# Altium project GTV3.4_Board.PrjPcb (part 11 of 11)
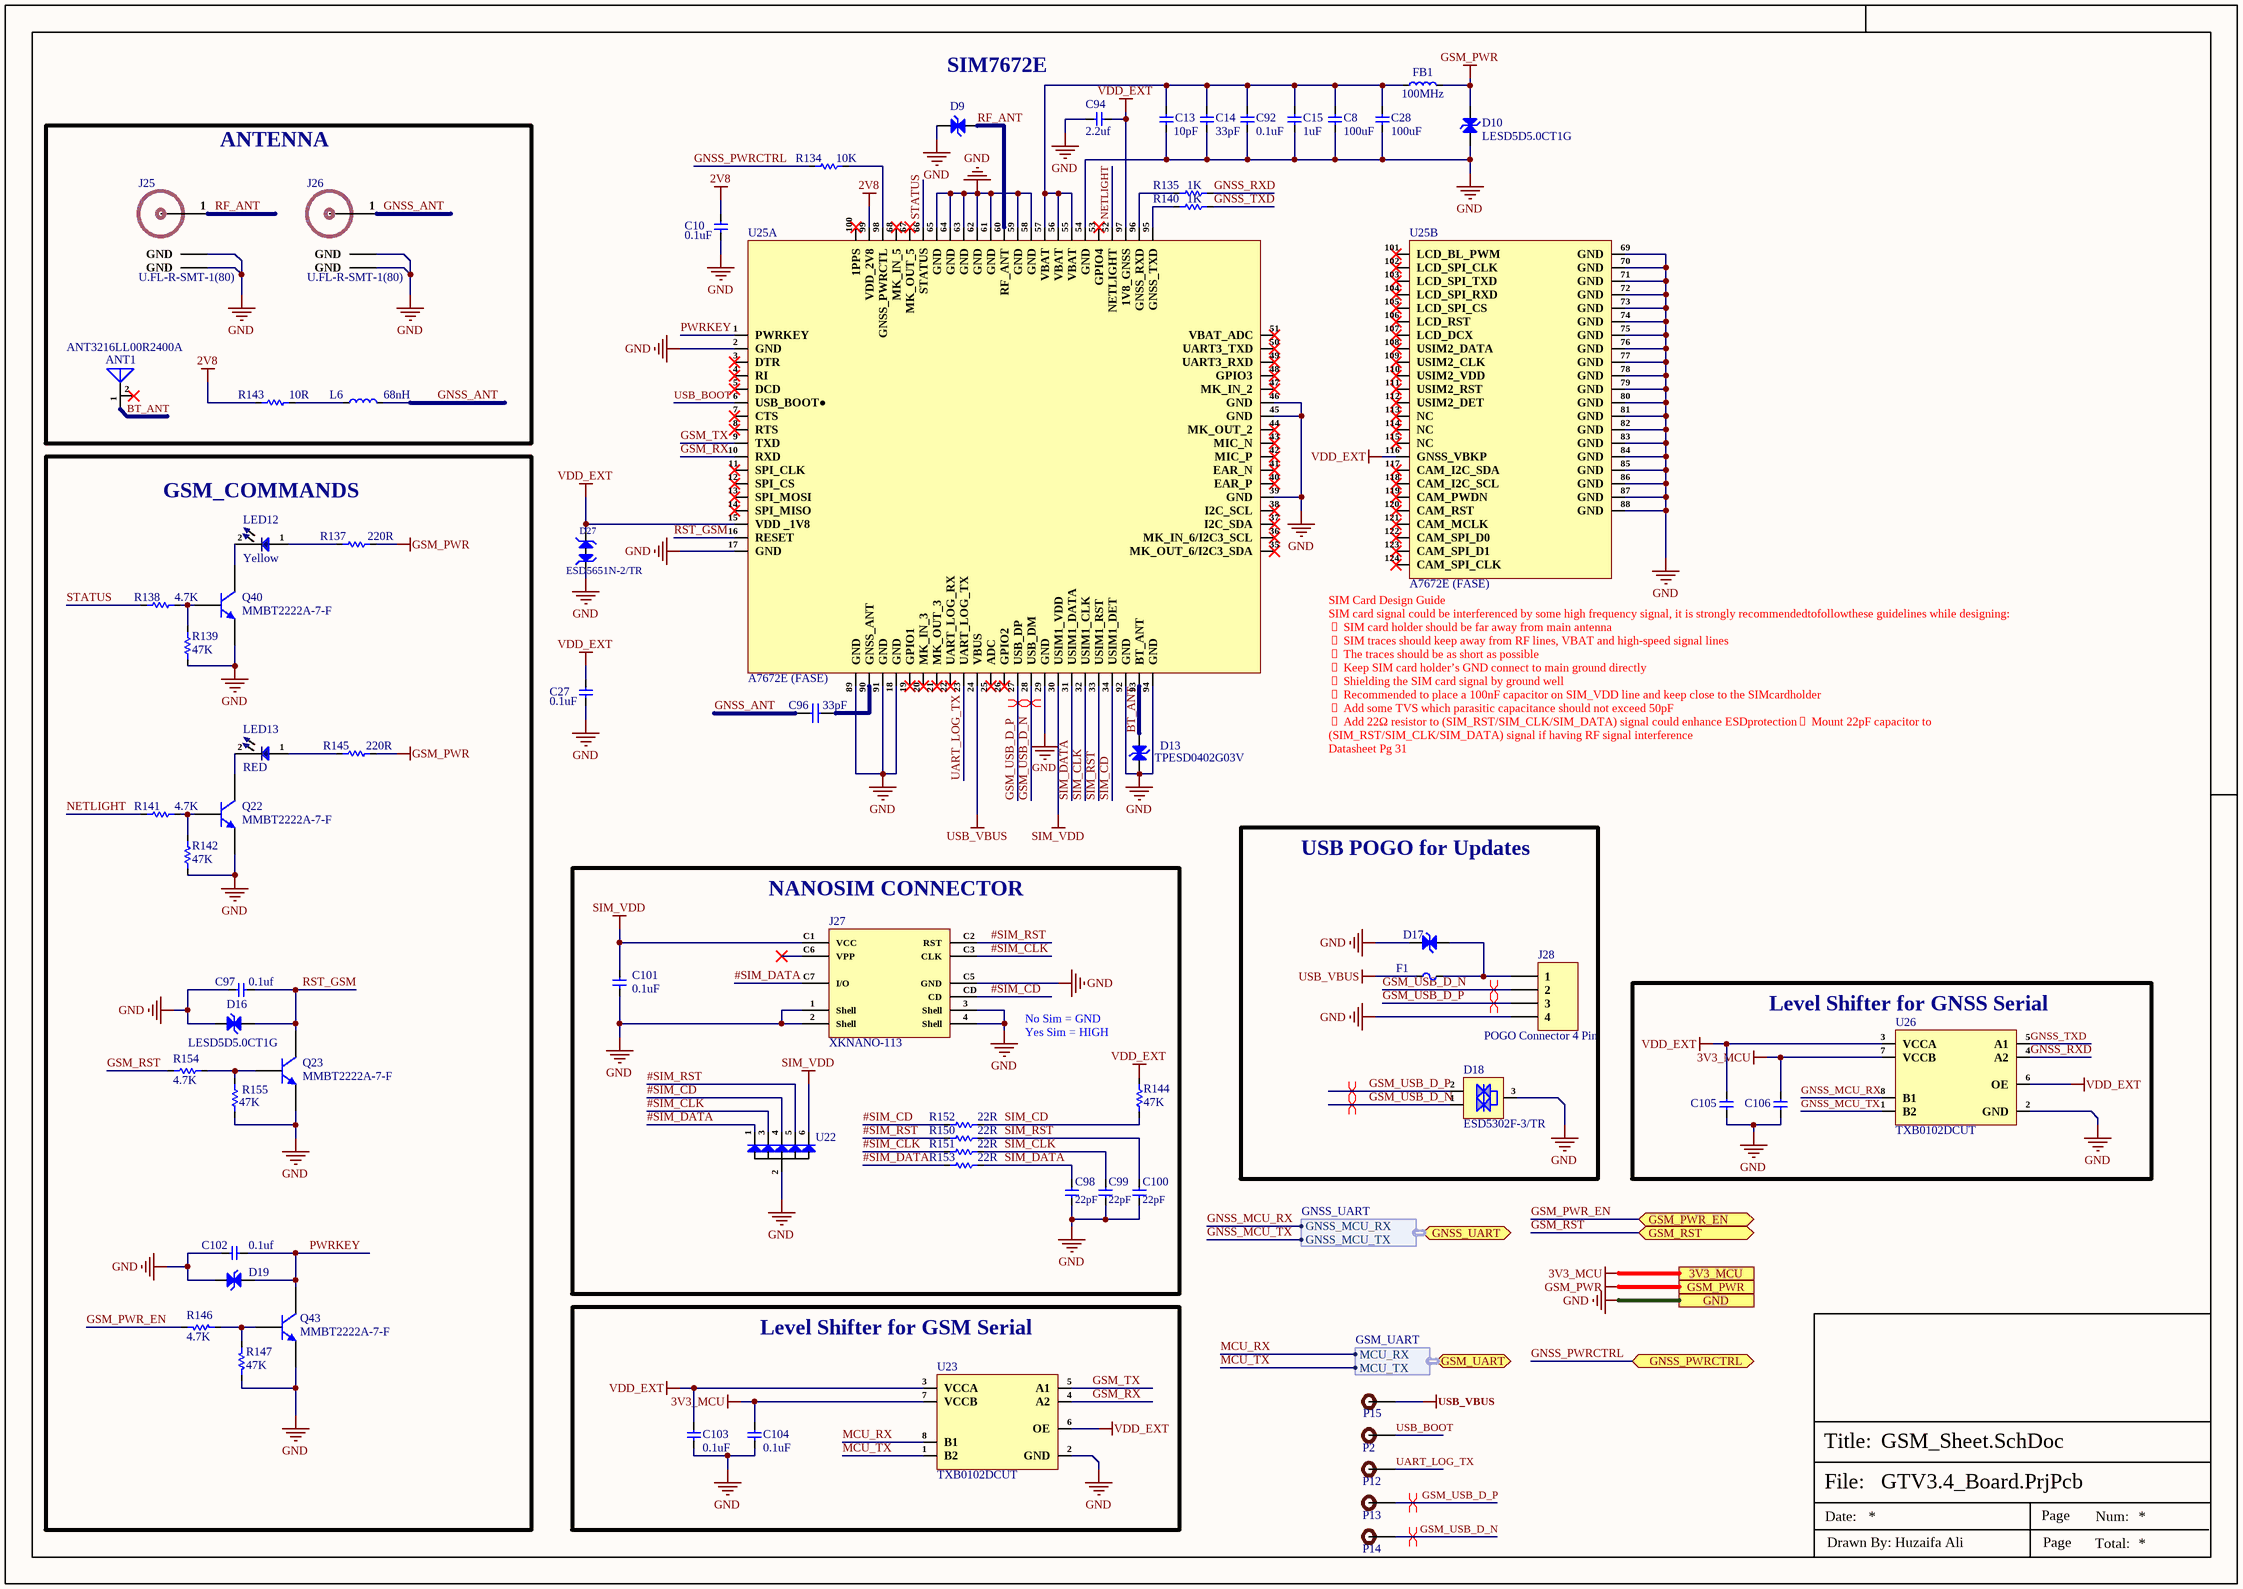
[diagram p25: GSM_Sheet.SchDoc]

## Sheet GSM_Sheet.SchDoc (continued)

### Library data of the parts (continued)
R154 = RC0402FR-074K7L: RES 4.7K OHM 1% 1/16W 0402; Manufacturer: Yageo; Item Type: Resistor; Voltage Rating (DC): 50V; Power Rating: 62.5mW; Resistance: 4.7kR; Temperature Coefficient: 100ppm/°C; Max Power Dissipation: 63mW; Manufacturer Part Number: RC0402FR-074K7L; RoHS: Yes; Category: Chip SMD Resistors; ComponentLink1URL: https://datasheet.ciiva.com/22661/1686128-22661342.pdf?src-supplier=Element14; ComponentLink1Description: https://datasheet.ciiva.com/22661/1686128-22661342.pdf?src-supplier=Element14; ComponentLink2URL: https://datasheet.ciiva.com/7850/1018594-7850022.pdf?src-supplier=Element14; ComponentLink2Description: https://datasheet.ciiva.com/7850/1018594-7850022.pdf?src-supplier=Element14; ComponentLink3URL: https://datasheet.ciiva.com/7850/1018594-7850023.pdf?src-supplier=Element14; ComponentLink3Description: https://datasheet.ciiva.com/7850/1018594-7850023.pdf?src-supplier=Element14; ComponentLink4URL: https://datasheet.ciiva.com/15215/getdatasheetpartid-328119-15215035.pdf?src-supplier=Verical; ComponentLink4Description: https://datasheet.ciiva.com/15215/getdatasheetpartid-328119-15215035.pdf?src-supplier=Verical; LCSC Part Number: C105871; Supplier 1: Avnet; Stock 1: 2420000; Pricing 1: 10000=0.00085 (USD); Case/Package: 0402; Number of Pins: 2; Case Code (Imperial): 0402; Case Code (Metric): 1005; Size Code: 0402; Min Operating Temperature: -55°C; Max Operating Temperature: 155°C; Tolerance: 1%; Voltage Rating: 50V; Packaging: Tape and Reel; Resistor Type: Thick Film; Termination: SMD/SMT; Features: Moisture Resistant; Series: RC; Number of Terminations: 2; Resistance Tolerance: 1%; Construction: Rectangular; Length: 1mm; Width: 0.5mm; Height: 0.32mm; Depth: 0.5mm; Height - Seated (Max): 0.016inch; RoHS Compliant: Yes; Reach SVHC Compliant: Yes; Military Standard: Not; Lead Free: Lead Free; Supplier Part Number 1: RC0402FR-074K7L
R155 = RC0402FR-0747KL: RES 47K OHM 1% 1/16W 0402; Manufacturer: Yageo; Temperature Coefficient: 100ppm/°C; Power Rating: 62.5mW; Voltage Rating: 50V; Max Power Dissipation: 63mW; Item Type: Resistor; Resistance: 47kR; Manufacturer Part Number: RC0402FR-0747KL; RoHS: Yes; Category: Chip SMD Resistors; Case/Package: 0402; Case Code (Metric): 1005; Case Code (Imperial): 0402; Min Operating Temperature: -55°C; Max Operating Temperature: 155°C; Tolerance: 1%; Resistor Type: Thick Film; Packaging: Tape and Reel; Package Quantity: 1; Number of Terminations: 2; Termination: SMD/SMT; Features: Moisture Resistant; Series: RC; Resistance Tolerance: 1%; Construction: Rectangular; Length: 1mm; Width: 0.02inch; Height: 0.016inch; Depth: 0.5mm; Military Standard: Not; RoHS Compliant: Yes; Lead Free: Lead Free; ComponentLink1URL: https://datasheet.ciiva.com/46412/1018594-46412839.pdf?src-supplier=Element14; ComponentLink1Description: https://datasheet.ciiva.com/46412/1018594-46412839.pdf?src-supplier=Element14; ComponentLink2URL: https://datasheet.ciiva.com/2453/pyu-r-int-thick-7-2453389.pdf?src-supplier=Digi-Key; ComponentLink2Description: https://datasheet.ciiva.com/2453/pyu-r-int-thick-7-2453389.pdf?src-supplier=Digi-Key; ComponentLink3URL: https://datasheet.ciiva.com/2453/pyu-r-int-thick-7-2453390.pdf?src-supplier=Digi-Key; ComponentLink3Description: https://datasheet.ciiva.com/2453/pyu-r-int-thick-7-2453390.pdf?src-supplier=Digi-Key; ComponentLink4URL: https://datasheet.ciiva.com/2453/pyu-r-int-thick-7-2453388.pdf?src-supplier=Digi-Key; ComponentLink4Description: https://datasheet.ciiva.com/2453/pyu-r-int-thick-7-2453388.pdf?src-supplier=Digi-Key; ComponentLink5URL: https://datasheet.ciiva.com/15189/getdatasheetpartid-323748-15189466.pdf?src-supplier=Verical; ComponentLink5Description: https://datasheet.ciiva.com/15189/getdatasheetpartid-323748-15189466.pdf?src-supplier=Verical; ComponentLink6URL: https://datasheet.ciiva.com/16793/pyu-rc0402-51-rohs-l-6-r-16793430.pdf?src-supplier=Future+Electronics; ComponentLink6Description: https://datasheet.ciiva.com/16793/pyu-rc0402-51-rohs-l-6-r-16793430.pdf?src-supplier=Future+Electronics; LCSC Part Number: C93943; Supplier 1: Avnet; Stock 1: 680000; Pricing 1: 10000=0.00085, 20000=0.00087, 40000=0.00084, 60000=0.00083, 80000=0.00079, 100000=0.00078, 1000000=0.00076 (USD); Size Code: 0402; Supplier Part Number 1: RC0402FR-0747KL
U22 = SMF05CT1G-ES: 15V 5 Unidirectional 5V SOT-363 ESD Protection Devices ROHS; Manufacturer: ElecSuper; Item Type: ESD Diode; Manufacturer Part Number: SMF05CT1G-ES; Package: SOT-363; LCSC Part Number: C5180312; ComponentLink1Description: LCSC; ComponentLink1URL: https://www.lcsc.com/product-detail/ESD-Protection-Devices_ElecSuper-SMF05CT1G-ES_C5180312.html
U23 U26 = TXB0102DCUT: IC TRNSLTR BIDIRECTIONAL US8; Manufacturer: Texas Instruments; Propagation Delay: 31ns; Min Supply Voltage: 1.65V; Max Supply Voltage: 5.5V; Data Rate: 100Mbps; Number of Channels: 2; Logic Function: Translator; Turn-On Delay Time: 7.4ns; High Level Output Current: -20uA; Low Level Output Current: 20uA; Output Type: 3-STATE; Output Current: 50mA; Supplier 1: Arrow Electronics; Manufacturer Part Number: TXB0102DCUT; RoHS: Yes; Category: Integrated Circuits (ICs); Stock 1: 10; Pricing 1: 1=0.79330, 10=0.66470, 25=0.65820, 250=0.37450, 500=0.36200, 1000=0.29770, 2500=0.28440 (USD); Mount: Surface Mount; Case/Package: VSSOP; Number of Pins: 8; Weight: 0.000339oz; Contact Plating: Gold; Min Operating Temperature: -40°C; Max Operating Temperature: 85°C; Packaging: Tape and Reel; Package Quantity: 1; Number of Bits: 2; Series: -; Number of Inputs: 2; Length: 2.3mm; Width: 2mm; Height: 0.85mm; Radiation Hardening: No; Lead Free: Lead Free; RoHS Compliant: Yes; REACH SVHC: No SVHC; ComponentLink1URL: https://datasheet.ciiva.com/4226/sces641b-4226901.pdf?src-supplier=Arrow+Electronics; ComponentLink1Description: https://datasheet.ciiva.com/4226/sces641b-4226901.pdf?src-supplier=Arrow+Electronics; ComponentLink2URL: https://datasheet.ciiva.com/15096/getdatasheetpartid-226009-15096242.pdf?src-supplier=Verical; ComponentLink2Description: https://datasheet.ciiva.com/15096/getdatasheetpartid-226009-15096242.pdf?src-supplier=Verical; ComponentLink3URL: https://datasheet.ciiva.com/14287/txb0102-14287498.pdf?src-supplier=Avnet; ComponentLink3Description: https://datasheet.ciiva.com/14287/txb0102-14287498.pdf?src-supplier=Avnet; ComponentLink4URL: https://datasheet.ciiva.com/14287/txb0102-14287370.pdf?src-supplier=Avnet; ComponentLink4Description: https://datasheet.ciiva.com/14287/txb0102-14287370.pdf?src-supplier=Avnet; ComponentLink5URL: https://datasheet.ciiva.com/6619/txb0102-6619255.pdf?src-supplier=Digi-Key; ComponentLink5Description: https://datasheet.ciiva.com/6619/txb0102-6619255.pdf?src-supplier=Digi-Key; ComponentLink6URL: https://datasheet.ciiva.com/6619/txb0102-6619256.pdf?src-supplier=Digi-Key; ComponentLink6Description: https://datasheet.ciiva.com/6619/txb0102-6619256.pdf?src-supplier=Digi-Key; ComponentLink7URL: https://datasheet.ciiva.com/6619/txb0102-6619257.pdf?src-supplier=Digi-Key; ComponentLink7Description: https://datasheet.ciiva.com/6619/txb0102-6619257.pdf?src-supplier=Digi-Key; Supplier Part Number 1: TXB0102DCUT
U25 = A7672E (FASE): RF TXRX MODULE CELLULAR SMD; Manufacturer: SIMCom Wireless Solutions Limited; Item Type: IC Module; Manufacturer Part Number: A7672E (FASE); Package: 80-SMD Module; ComponentLink1Description: Digikey; ComponentLink1URL: https://www.digikey.com/en/products/detail/simcom-wireless-solutions-limited/A7672E-FASE/15841437

## Sheet SD-Card-Sheet.SchDoc
size 420 x 297 mm
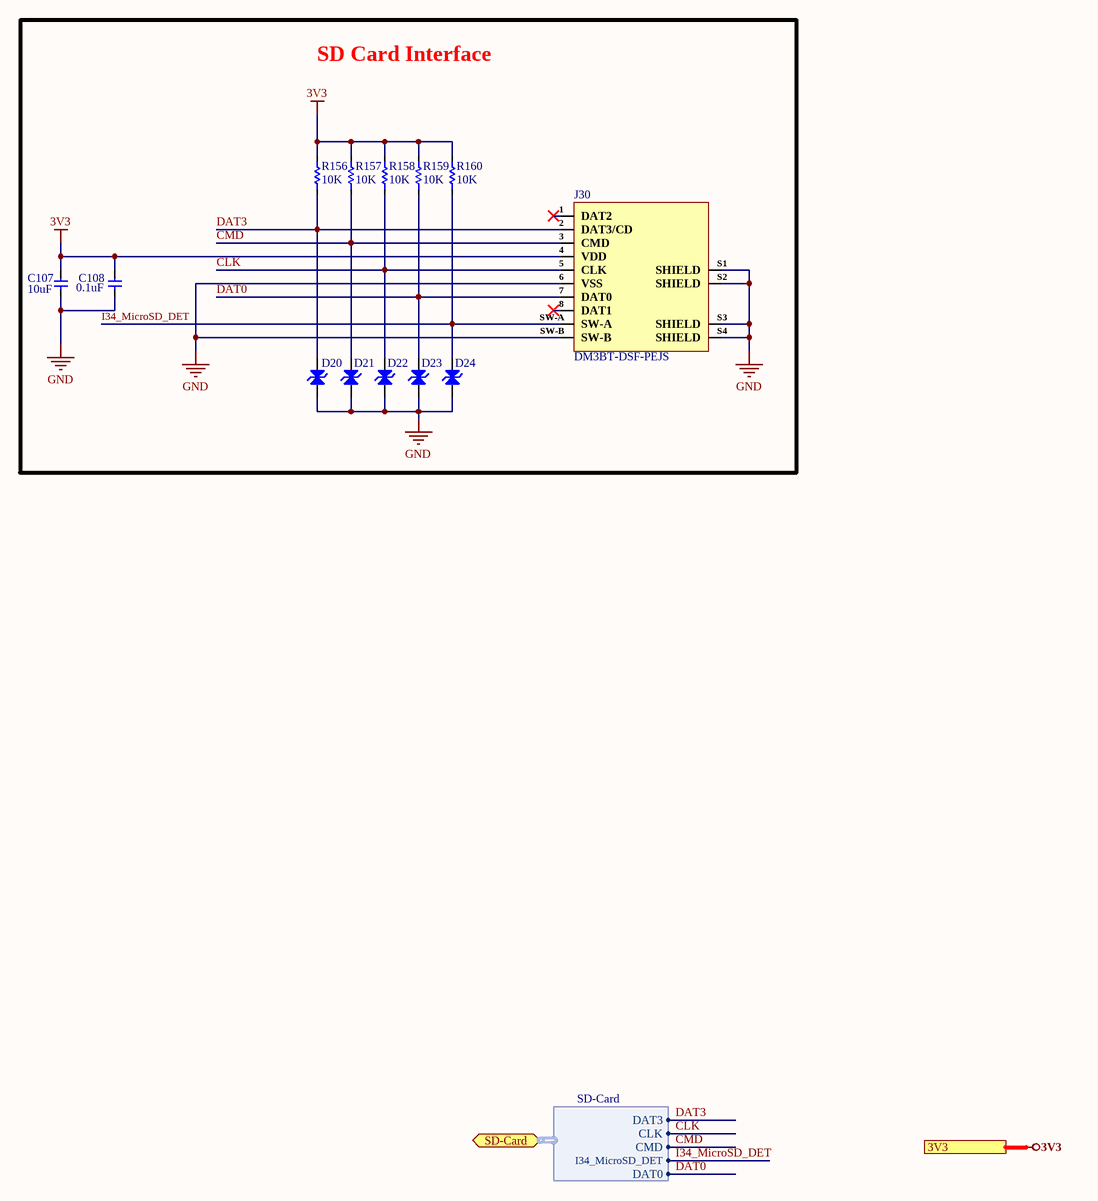
[diagram p21: SD-Card-Sheet.SchDoc]

### Parts
C107  10uF  [Cap-0402]
C108  0.1uF  [CAP-0201]
D20  LESD8D3.3CAT5G  [SOD-882]  (value not drawn)
D21  LESD8D3.3CAT5G  [SOD-882]  (value not drawn)
D22  LESD8D3.3CAT5G  [SOD-882]  (value not drawn)
D23  LESD8D3.3CAT5G  [SOD-882]  (value not drawn)
D24  LESD8D3.3CAT5G  [SOD-882]  (value not drawn)
J30  DM3BT-DSF-PEJS  [DM3BT-DSF-PEJS]
R156  10K  [Res-0201]
R157  10K  [Res-0201]
R158  10K  [Res-0201]
R159  10K  [Res-0201]
R160  10K  [Res-0201]

### Blocks framed on the sheet
SD Card Interface: C107 C108 D20-D24 J30 R156-R160

### Ports
3V3, SD-Card (bidir, harness SD-Card)

### Harnesses
SD-Card: DAT3, CLK, CMD, DAT0, I34_MicroSD_DET

### Nets
3V3: C107.2 C108.2 J30.4(VDD) R156.2 R157.2 R158.2 R159.2 R160.2 ; port 3V3
GND: C107.1 C108.1 D20.1(A) D21.1(A) D22.1(A) D23.1(A) D24.1(A) J30.6(VSS) J30.S1(SHIELD) J30.S2(SHIELD) J30.S3(SHIELD) J30.S4(SHIELD) J30.SW-B
CLK: D22.2(A) J30.5(CLK) R158.1 ; port SD-Card.CLK
CMD: D21.2(A) J30.3(CMD) R157.1 ; port SD-Card.CMD
DAT0: D23.2(A) J30.7(DAT0) R159.1 ; port SD-Card.DAT0
DAT3: D20.2(A) J30.2(DAT3/CD) R156.1 ; port SD-Card.DAT3
I34_MicroSD_DET: D24.2(A) J30.SW-A R160.1 ; port SD-Card.I34_MicroSD_DET

Not connected (* = marked no-connect by the designer): J30 1(DAT2)* 8(DAT1)*

### Notes on the sheet
- File:
- Title:
- Date:
- Page
- Num:
- Total:
- Drawn By: Huzaifa Ali

### Library data of the parts
C107 = CC0402MRX5R6BB106: CAP CER 10UF 10V X5R 0402; Manufacturer: Yageo; Tolerance: 20%; Item Type: Capacitor; Supplier 1: Future Electronics; Manufacturer Part Number: CC0402MRX5R6BB106; RoHS: Yes; Category: Ceramic Capacitors; Stock 1: 80000; Pricing 1: 10000=0.02650, 20000=0.02590, 30000=0.02550, 40000=0.02530, 50000=0.02450 (USD); Mount: Surface Mount; Case/Package: 0402; Case Code (Imperial): 0402; Case Code (Metric): 1005; Min Operating Temperature: -55°C; Max Operating Temperature: 85°C; Packaging: Tape and Reel; Capacitance: 10uF; Voltage Rating: 10V; RoHS Compliant: Yes; ComponentLink1URL: http://www.yageo.com/documents/recent/UPY-GPHC_X5R_4V-to-50V_25.pdf?src-supplier=Digi-Key; ComponentLink1Description: http://www.yageo.com/documents/recent/UPY-GPHC_X5R_4V-to-50V_25.pdf?src-supplier=Digi-Key; Supplier Part Number 1: 6097631; LCSC Part Number: C962143
C108 = GRM033C81E104KE14D: CAP CER 0.1UF 25V X6S 0201; Manufacturer: Murata; Capacitance: 100nF; Tolerance: 10%; Supplier 1: Digi-Key; Manufacturer Part Number: GRM033C81E104KE14D; RoHS: Yes; Category: Ceramic Capacitors; Stock 1: 91; Pricing 1: 1=0.10000, 10=0.05100, 50=0.02780, 100=0.02260, 500=0.01616, 1000=0.01270, 2500=0.01155, 5000=0.01063 (USD); Mount: Surface Mount; Case/Package: 0201; Case Code (Metric): 0603; Case Code (Imperial): 0201; Min Operating Temperature: -55°C; Max Operating Temperature: 105°C; Dielectric: X6S; Packaging: Tape and Reel; Voltage Rating: 25V; Package Quantity: 15000; Voltage Rating (DC): 25V; Termination: SMD/SMT; Length: 0.024inch; Width: 0.3mm; Height: 0.3mm; Thickness: 0.013inch; RoHS Compliant: Yes; ComponentLink1URL: http://www.mouser.com/ds/2/281/c02e-2905.pdf?src-supplier=Mouser; ComponentLink1Description: http://www.mouser.com/ds/2/281/c02e-2905.pdf?src-supplier=Mouser; ComponentLink2URL: http://www.farnell.com/datasheets/2722733.pdf?src-supplier=Farnell; ComponentLink2Description: http://www.farnell.com/datasheets/2722733.pdf?src-supplier=Farnell; ComponentLink3URL: http://search.murata.co.jp/Ceramy/image/img/A01X/G101/ENG/GRM033C81E104KE14-01.pdf?src-supplier=Digi-Key; ComponentLink3Description: http://search.murata.co.jp/Ceramy/image/img/A01X/G101/ENG/GRM033C81E104KE14-01.pdf?src-supplier=Digi-Key; Supplier Part Number 1: 490-10403-1-ND; Weight: 1.2E-05oz
D20-D24 = LESD8D3.3CAT5G: 5V 10V 3.3V Bi-Directional SOD-882 ESD Protection Devices ROHS; Manufacturer: LRC; Manufacturer Part Number: LESD8D3.3CAT5G; Package: SOD-882; LCSC Part Number: C172409; Item Type: Protection Device; ComponentLink1Description: LCSC; ComponentLink1URL: https://www.lcsc.com/product-detail/span-style-background-color-ff0-ESD-span-Protection-Devices_LRC-LESD8D3-3CAT5G_C172409.html
J30 = DM3BT-DSF-PEJS: CONN MICRO SD CARD PUSH-PUSH R/A; Manufacturer: Hirose; Max Current Rating: 500mA; Contact Resistance: 100mR; Voltage Rating (AC): 125V; Gender: Female; Number of Contacts: 8; Connector Type: Connector,Socket; Insulation Resistance: 1GR; Pitch: 1.1mm; Item Type: SD Card Connector; Supplier 1: Future Electronics; Manufacturer Part Number: DM3BT-DSF-PEJS; RoHS: Yes; Category: Memory Connectors; Stock 1: 9600; Pricing 1: 1200=1.39000 (USD); Mount: Surface Mount,Reverse; Contact Material: Copper Alloy,Copper; Contact Plating: Gold; Housing Material: Polymer; Min Operating Temperature: -25°C; Max Operating Temperature: 85°C; Number of Rows: 1; Packaging: Tape and Reel; Current Rating: 500mA; Package Quantity: 1; Termination: Solder; Max Voltage Rating (AC): 125V; Number of Positions: 8; Orientation: Right Angle; Series: DM3; Length: 13.85mm; Width: 16.05mm; Depth: 1.83mm; Radiation Hardening: No; Reach SVHC Compliant: Yes; Lead Free: Lead Free; Flammability Rating: UL94 V-0; RoHS Compliant: Yes; ComponentLink1URL: https://datasheet.ciiva.com/683/doc-1806131255093-683387.pdf?src-supplier=Digi-Key; ComponentLink1Description: https://datasheet.ciiva.com/683/doc-1806131255093-683387.pdf?src-supplier=Digi-Key; Supplier Part Number 1: 3000978; LCSC Part Number: C597972
R156-R160 = RC0201FR-0710KL: RES SMD 10K OHM 1% 1/20W 0201; Manufacturer: Yageo; Item Type: Resistor; Manufacturer Part Number: RC0201FR-0710KL; ComponentLink7URL: https://www.lcsc.com/product-detail/Chip-Resistor-Surface-Mount_YAGEO-RC0201FR-0710KL_C106225.html; ComponentLink7Description: LCSC; LCSC Part Number: C106225; Package: 0201

## Nets that join several sheets
3V3: Regulator_Section (5 pins), Connector_Section (8 pins), Temperature_Sense_Section (7 pins), Receiver_Section (6 pins), Switch_Sheet (R18.2 R19.2), Heater_Section (10 pins), Sensor_Section (R23.2 R35.2 R76.2 R79.2), HMI_Encoder_NFC_Sheet (J24.5), Ultra_Sonic_Section (7 pins), SD-Card-Sheet (8 pins)
3V3_MCU: Regulator_Section (7 pins), Controller_Section (31 pins), LED_Section (Q26.1 R73.1), GSM_Sheet (C104.1 C106.1 U23.7 U26.7)
5V: Current_Sense_Section (6 pins), Regulator_Section (9 pins), Connector_Section (J19.1 R21.2 SB43.1), Receiver_Section (C71.2 U29.5), Gate_Driver_Section (6 pins), HMI_Encoder_NFC_Sheet (J23.4)
5V-LED: Regulator_Section (5 pins), LED_Section (J18.1 R74.1)
BAT: Reverse Protection_Section (C2.2 J2.1 R149.2), Solar_Charge_Controller (7 pins)
GND: Current_Sense_Section (12 pins), Voltage_Monitoring_Section (5 pins), Regulator_Section (39 pins), Reverse Protection_Section (5 pins), Solar_Charge_Controller (11 pins), Connector_Section (28 pins), Temperature_Sense_Section (7 pins), Receiver_Section (22 pins), Controller_Section (39 pins), Switch_Sheet (C37.1 C38.1 SW1.1 SW2.1), Gate_Driver_Section (9 pins), Heater_Section (32 pins), Sensor_Section (8 pins), LED_Section (J18.3 Q25.2 R72.2), Valve_Section (20 pins), HMI_Encoder_NFC_Sheet (6 pins), Ultra_Sonic_Section (6 pins), GSM_Sheet (87 pins), SD-Card-Sheet (13 pins)
GSM_PWR: Regulator_Section (18 pins), GSM_Sheet (D10.2 FB1.2 R137.2 R145.2)
VCC: Current_Sense_Section (U1.3 U1.4 U2.3 U2.4), Reverse Protection_Section (SB40.2), Connector_Section (SB5.1 SB44.1), Controller_Section (R12.2), Heater_Section (16 pins), Sensor_Section (10 pins), LED_Section (P19.1), Valve_Section (15 pins), HMI_Encoder_NFC_Sheet (J22.7 J22.8), Ultra_Sonic_Section (J29.1)
VCC#12: Voltage_Monitoring_Section (Q32.3 R34.1 SB39.2), Regulator_Section (D11.2)
VCC#P: Voltage_Monitoring_Section (SB9.1), Reverse Protection_Section (9 pins)
A: Receiver_Section (U16.10), Controller_Section (U21.119)
ADC_14: Temperature_Sense_Section (P4.2), Controller_Section (U21.41)
ADC_15: Temperature_Sense_Section (P4.5), Controller_Section (U21.47)
ADDR-LED: Controller_Section (U21.65), LED_Section (Q26.2 R73.2)
AN1: Temperature_Sense_Section (P8.2), Controller_Section (U21.21)
AN2: Temperature_Sense_Section (P8.5), Controller_Section (U21.18)
AN10: Temperature_Sense_Section (P3.2), Controller_Section (U21.35)
AN11: Temperature_Sense_Section (P3.5), Controller_Section (U21.40)
AN12: Temperature_Sense_Section (P5.2), Controller_Section (U21.45)
AN13: Temperature_Sense_Section (P5.5), Controller_Section (U21.22)
B: Receiver_Section (U16.9), Controller_Section (U21.122)
BACKUP: Regulator_Section (C123.2 R162.1 R163.2), Controller_Section (U21.124)
BUZZER: Connector_Section (R62.2), Controller_Section (U21.82)
CE: Solar_Charge_Controller (Q39.1), Controller_Section (U21.13)
CLK: Controller_Section (U21.74), SD-Card-Sheet (D22.2 J30.5 R158.1)
CMD: Controller_Section (U21.76), SD-Card-Sheet (D21.2 J30.3 R157.1)
CRNT_SNS.IP+_1: Current_Sense_Section (U1.1 U1.2), Gate_Driver_Section (D25.2 J3.2)
CRNT_SNS.IP+_2: Current_Sense_Section (U2.1 U2.2), Gate_Driver_Section (D26.2 J4.2)
CRNT_VOUT.VIOUT1: Current_Sense_Section (C11.1 R5.2 R7.1), Controller_Section (U21.28)
CRNT_VOUT.VIOUT2: Current_Sense_Section (C19.1 R8.2 R10.1), Controller_Section (U21.29)
DAT0: Controller_Section (U21.75), SD-Card-Sheet (D23.2 J30.7 R159.1)
DAT3: Controller_Section (U21.73), SD-Card-Sheet (D20.2 J30.2 R156.1)
ENA: Controller_Section (U21.7), Gate_Driver_Section (U12.2)
FILL_CNTRL: Controller_Section (U21.5), Valve_Section (Q1.1 R69.1)
FLOW_MCU1: Controller_Section (U21.79), Sensor_Section (R76.1 U8.4)
FLOW_MCU2: Controller_Section (U21.78), Sensor_Section (R35.1 U14.4)
FLOW_MCU3: Controller_Section (U21.77), Sensor_Section (R23.1 U15.4)
FLUSH_CNTRL: Controller_Section (U21.4), Valve_Section (Q2.1 R70.1)
GATE_DRV.INA_1: Controller_Section (U21.59), Gate_Driver_Section (U10.2)
GATE_DRV.INB_1: Controller_Section (U21.60), Gate_Driver_Section (U11.2)
GNSS_MCU_RX: Receiver_Section (R169.1 U16.4), GSM_Sheet (U26.8)
GNSS_MCU_TX: Receiver_Section (R104.1 U16.11), GSM_Sheet (U26.1)
GNSS_PWRCTRL: Controller_Section (U21.10), GSM_Sheet (R134.2)
GSM_PWR_EN: Controller_Section (U21.141), GSM_Sheet (R146.2)
GSM_RST: Controller_Section (U21.142), GSM_Sheet (R154.1)
HC_PWR: Receiver_Section (R170.2 U29.4), Controller_Section (U21.117)
HEAT_CNTRL: Controller_Section (U21.93), Heater_Section (R33.1)
HMI_UART.RX_HMI: Controller_Section (U21.36), HMI_Encoder_NFC_Sheet (J22.4)
HMI_UART.TX_HMI: Controller_Section (U21.37), HMI_Encoder_NFC_Sheet (J22.5)
I2C_ENCODER.SCL: Controller_Section (U21.136), HMI_Encoder_NFC_Sheet (J23.2)
I2C_ENCODER.SDA: Controller_Section (U21.137), HMI_Encoder_NFC_Sheet (J23.1)
I34_MicroSD_DET: Controller_Section (U21.140), SD-Card-Sheet (D24.2 J30.SW-A R160.1)
INH: Receiver_Section (U16.6), Controller_Section (U21.123)
IO_C9: Controller_Section (U21.15), Heater_Section (R28.1)
IRQ_NFC: Controller_Section (U21.139), HMI_Encoder_NFC_Sheet (J24.7)
LED_SIG.W_LED_CNTRL: Controller_Section (U21.68), LED_Section (Q25.1 R72.1)
LEVEL_MCU: Controller_Section (U21.85), Sensor_Section (R79.1 U9.4)
MCU_RX: Controller_Section (U21.102), GSM_Sheet (U23.8)
MCU_TX: Controller_Section (U21.101), GSM_Sheet (U23.1)
MEM_CNTRL: Controller_Section (U21.3), Valve_Section (Q3.1 R4.1)
MISO_NFC: Controller_Section (U21.134), HMI_Encoder_NFC_Sheet (J24.2)
MOSI_NFC: Controller_Section (U21.135), HMI_Encoder_NFC_Sheet (J24.3)
NRST: Connector_Section (J1.10), Controller_Section (C73.2 SW3.3 U21.25)
PIR_OUT: Connector_Section (R116.2), Controller_Section (U21.99)
PM_CNTRL: Controller_Section (U21.2), Valve_Section (Q4.1 R6.1)
PS_MCU: Connector_Section (SB37.2 SB38.2), Controller_Section (U21.80)
PWM_D2: Connector_Section (Q38.3 R20.1), Controller_Section (U21.81)
RE/DE/RS485/T: Controller_Section (U21.88), Ultra_Sonic_Section (R58.1 R59.1 U24.2 U24.3)
READY: Regulator_Section (R161.1 U5.3), Controller_Section (U21.125)
RS485/RS232/T.RXD/RS485/RS232/T: Controller_Section (U21.87), Ultra_Sonic_Section (R57.1 U24.1)
RS485/RS232/T.TXD/RS485/RS232/T: Controller_Section (U21.89), Ultra_Sonic_Section (R60.1 U24.4)
RS_CNTRL: Controller_Section (U21.1), Valve_Section (Q8.1 R9.1)
RX: Receiver_Section (U16.3), Controller_Section (U21.116)
RXIN1: Controller_Section (U21.70), Heater_Section (R91.2 R101.1)
RXIN2: Controller_Section (U21.112), Heater_Section (R92.2 R102.1)
SCK_NFC: Controller_Section (U21.133), HMI_Encoder_NFC_Sheet (J24.1)
SET: Receiver_Section (U28.5), Controller_Section (U21.118)
SHDN: Reverse Protection_Section (R64.2 SB7.2), Controller_Section (U21.14)
SIGNALS.TX: Receiver_Section (U16.13), Controller_Section (U21.113)
SNS_IN: Connector_Section (SB3.2), Controller_Section (U21.100)
SPI_NFC.SS_NFC: Controller_Section (U21.110), HMI_Encoder_NFC_Sheet (J24.4)
SW_1: Controller_Section (U21.114), Switch_Sheet (C37.2 R18.1 SW1.3)
SW_2: Controller_Section (U21.115), Switch_Sheet (C38.2 R19.1 SW2.3)
SWCLK: Connector_Section (J1.4), Controller_Section (U21.109)
SWDIO: Connector_Section (J1.2), Controller_Section (U21.105)
TDS_1: Temperature_Sense_Section (P3.4), Controller_Section (U21.34)
TDS_2: Temperature_Sense_Section (P3.3), Controller_Section (U21.27)
TDS_3: Temperature_Sense_Section (P4.4), Controller_Section (U21.43)
TDS_4: Temperature_Sense_Section (P4.3), Controller_Section (U21.42)
TDS_5: Temperature_Sense_Section (P5.4), Controller_Section (U21.26)
TDS_6: Temperature_Sense_Section (P5.3), Controller_Section (U21.44)
TDS_7: Temperature_Sense_Section (P8.4), Controller_Section (U21.19)
TDS_8: Temperature_Sense_Section (P8.3), Controller_Section (U21.20)
TDS_IN.TEMP_SNS: Temperature_Sense_Section (P6.2), Controller_Section (R31.2 U21.64)
TXIN1: Controller_Section (U21.69), Heater_Section (R47.2)
TXIN2: Controller_Section (U21.111), Heater_Section (R46.2)
USB_D_N: Connector_Section (D4.2 J19.2), Controller_Section (U21.103)
USB_D_P: Connector_Section (D4.1 J19.3), Controller_Section (U21.104)